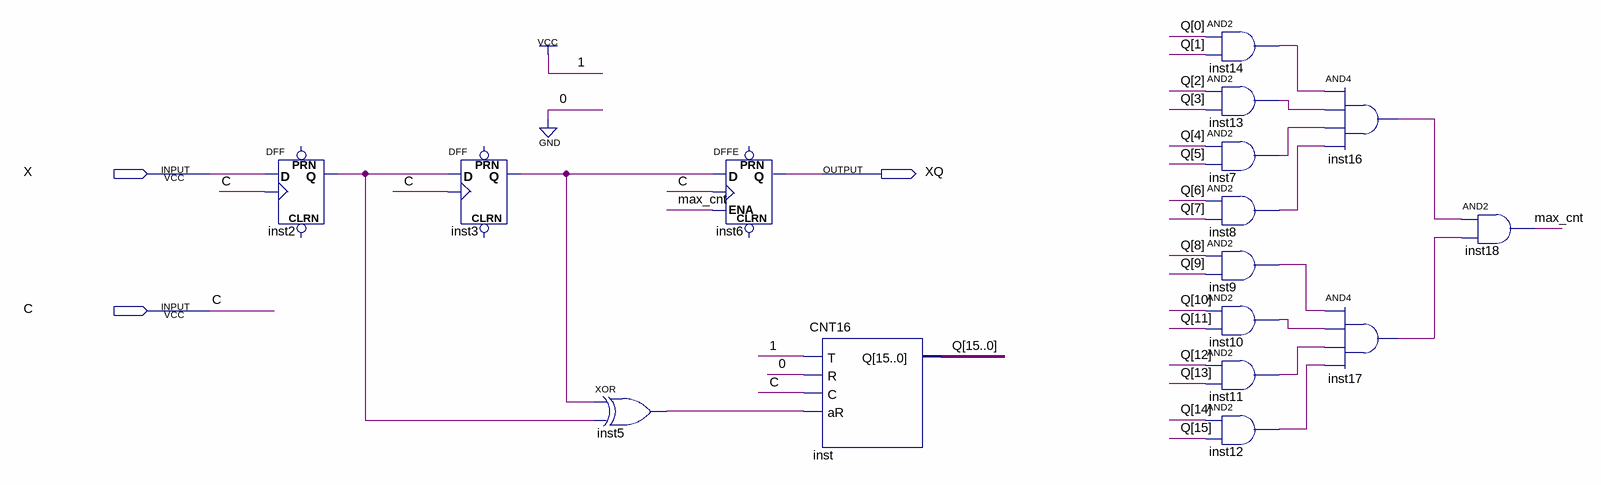
[diagram p0: schematic sheet]
// Quartus schematic DBNC.bdf as structural Verilog: 16 symbols, 3 pins
module DBNC (
  input  X,
  input  C,
  output XQ
);

  wire inst2_q, inst3_q, inst5_out, inst7_out, inst8_out, inst9_out, inst10_out, inst11_out, inst12_out,
       inst13_out, inst14_out, inst16_out, inst17_out, max_cnt;
  wire [15:0] Q;

  DFF inst2 (.CLK(C), .D(X), .Q(inst2_q));  // open: CLRN, PRN
  DFF inst3 (.CLK(C), .D(inst2_q), .Q(inst3_q));  // open: CLRN, PRN
  xor inst5 (inst5_out, inst3_q, inst2_q);
  DFFE inst6 (.D(inst3_q), .CLK(C), .ENA(max_cnt), .Q(XQ));  // open: PRN, CLRN
  CNT16 inst (.T(1'b1), .R(1'b0), .C(C), .aR(inst5_out), .Q(Q));
  and inst14 (inst14_out, Q[0], Q[1]);
  and inst13 (inst13_out, Q[2], Q[3]);
  and inst7 (inst7_out, Q[4], Q[5]);
  and inst8 (inst8_out, Q[6], Q[7]);
  and inst9 (inst9_out, Q[8], Q[9]);
  and inst10 (inst10_out, Q[10], Q[11]);
  and inst11 (inst11_out, Q[12], Q[13]);
  and inst12 (inst12_out, Q[14], Q[15]);
  and inst16 (inst16_out, inst14_out, inst13_out, inst7_out, inst8_out);
  and inst17 (inst17_out, inst9_out, inst10_out, inst11_out, inst12_out);
  and inst18 (max_cnt, inst16_out, inst17_out);
endmodule
